# EAGLE design 20m_QRPi_1V6 (EAGLE 6.4)
Assembly variants: 20m
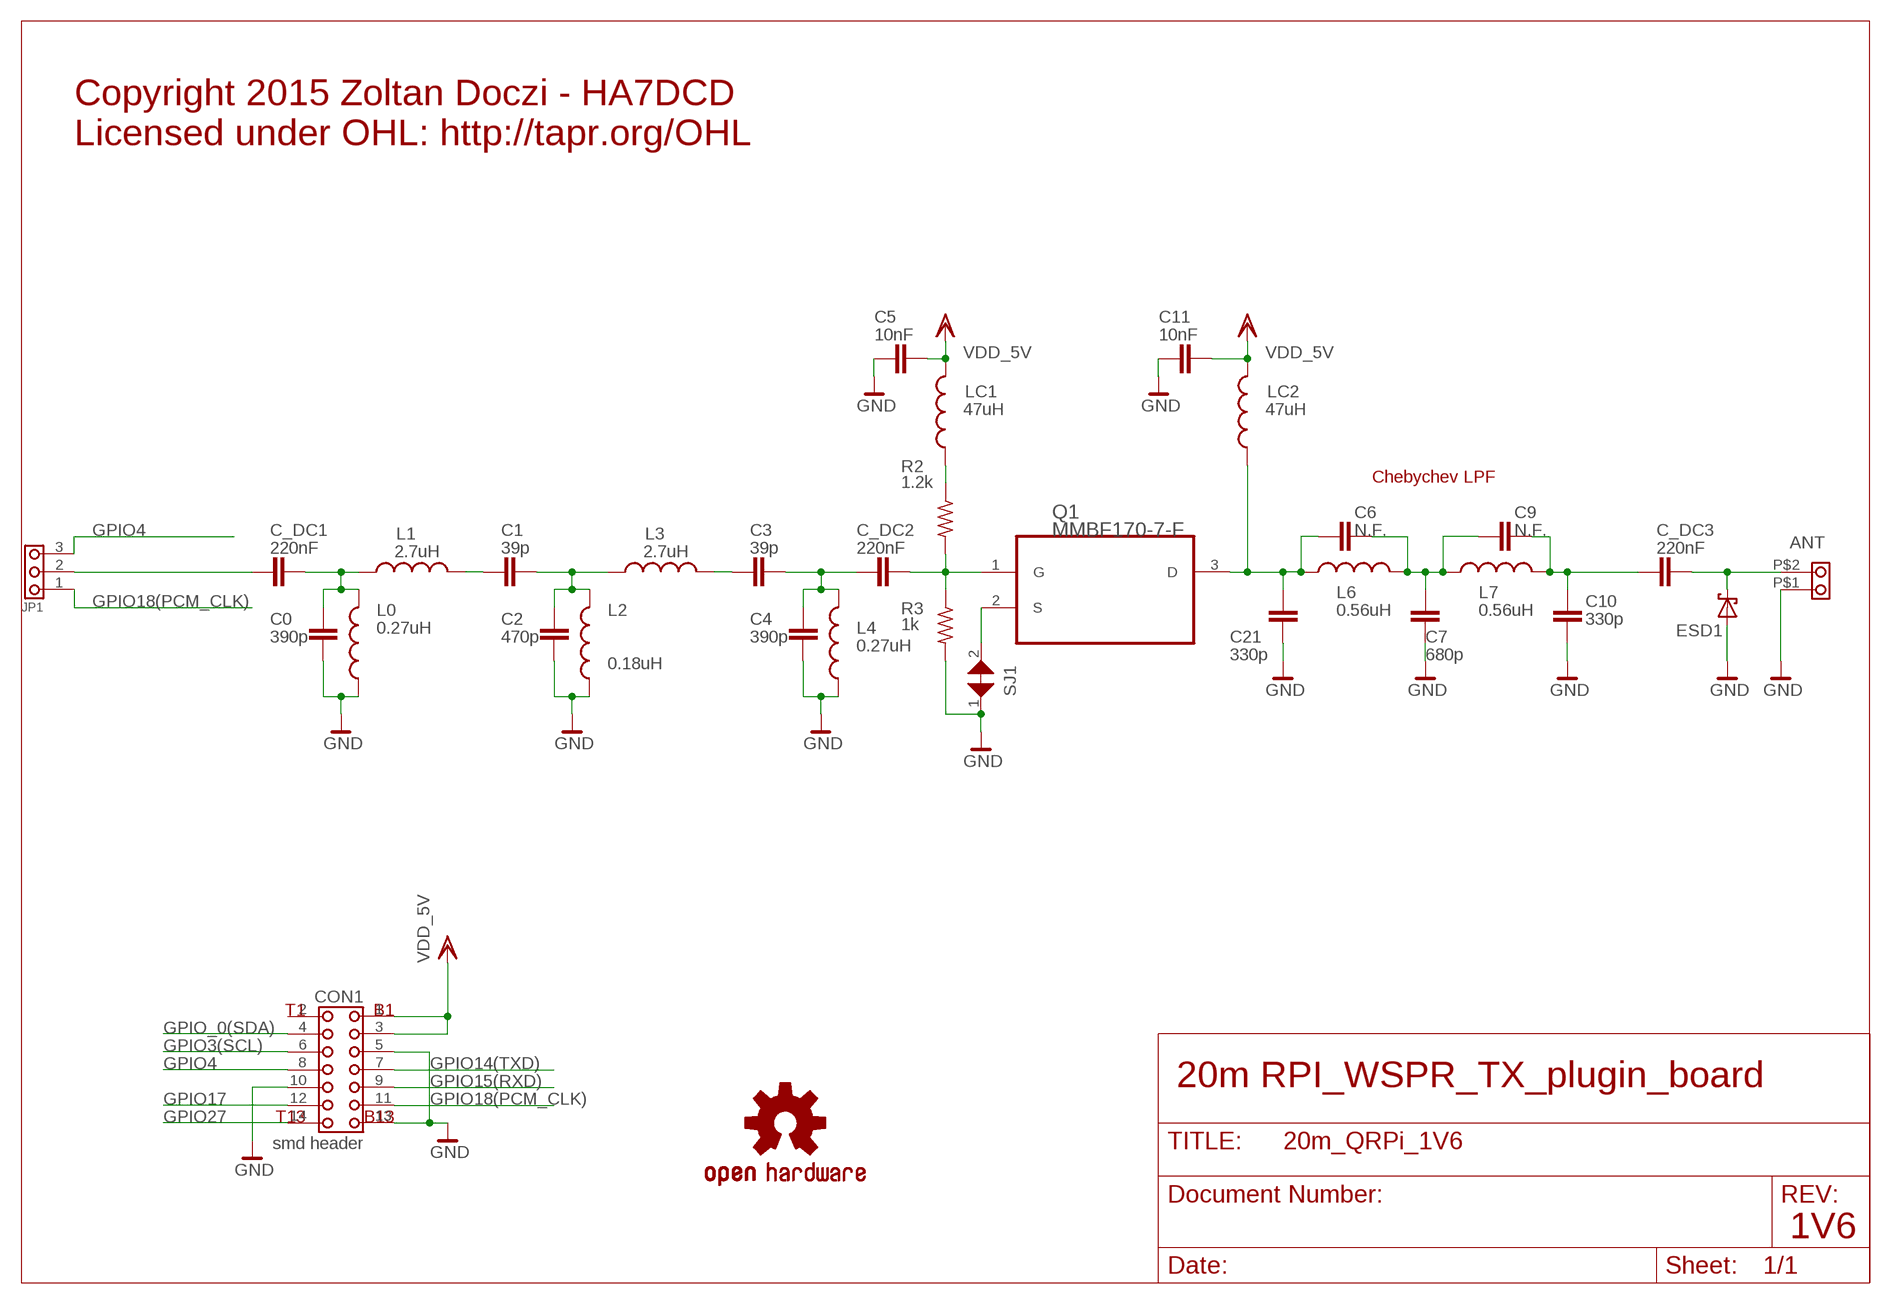
[diagram p0: schematic, sheet 1]

## Parts
ANT  TERMINAL_WIRE_2P_17256562P  [WIRE_CONTACT_2P]
C0  390p  CAP-SMD0603  [0603]
C1  39p  CAP-SMD0603  [0603]
C2  470p  CAP-SMD0603  [0603]
C3  39p  CAP-SMD0603  [0603]
C4  390p  CAP-SMD0603  [0603]
C5  10nF  CAP-SMD0603  [0603]
C6  N.F.  CAP-SMD0603  [0603]
C7  680p  CAP-SMD0603  [0603]
C9  N.F.  CAP-SMD0603  [0603]
C10  330p  CAP-SMD0603  [0603]
C11  10nF  CAP-SMD0603  [0603]
C21  330p  CAP-SMD0603  [0603]
C_DC1  220nF  CAP-SMD0603  [0603]
C_DC2  220nF  CAP-SMD0603  [0603]
C_DC3  220nF  CAP-SMD0603  [0603]
CON1  smd header  PINHD-2X7_SMD2X7_CROSSPCB_ASSYM_DUMMY26PIN  [2X7-SMT_CROSSPCB_ASSYM_DUMY26HOLES]
ESD1  PGB1010603NRHF  SMF33A-GS08_ESD0603  [0603]
JP1  N.F.  JUMPER3SHORT23  [PIN3-B_SHORT23]
L0  0.27uH  INDUCTOR_L_1210  [L1210]
L1  2.7uH  INDUCTOR_L_1210  [L1210]
L2  0.18uH  INDUCTOR_L_1210  [L1210]
L3  2.7uH  INDUCTOR_L_1210  [L1210]
L4  0.27uH  INDUCTOR_L_1210  [L1210]
L6  0.56uH  INDUCTOR_L_1210  [L1210]
L7  0.56uH  INDUCTOR_L_1210  [L1210]
LC1  47uH  INDUCTOR_L_1210  [L1210]
LC2  47uH  INDUCTOR_L_1210  [L1210]
Q1  MMBF170-7-F  [SOT103P240X110-3N]
R2  1.2k  R-US_R0402  [R0402]
R3  1k  R-US_R0402  [R0402]
SJ1  JUMPER_SMD_MICRO_SHORT  [JUMPER_SMD_MICRO_SHORT]
U$15  OSHW-LOGOS  [OSHW-LOGO-S]

## Nets
GND: ANT.P$1(A) C0.1 C2.1 C4.1 C5.2 C7.1 C10.1 C11.2 C21.1 CON1.5 CON1.10 CON1.13 ESD1.1(A) L0.1 L2.1 L4.1 R3.2 SJ1.1
GPIO3(SCL): CON1.6
GPIO4: CON1.8 JP1.3
GPIO14(TXD): CON1.7
GPIO15(RXD): CON1.9
GPIO17: CON1.12
GPIO18(PCM_CLK): CON1.11 JP1.1
GPIO27: CON1.14
GPIO_0(SDA): CON1.4
N$1: C1.2 L1.2
N$2: C0.2 C_DC1.1 L0.2 L1.1
N$3: C_DC2.1 Q1.1(G) R2.2 R3.1
N$4: Q1.2(S) SJ1.2
N$5: LC1.1 R2.1
N$6: C6.2 C21.2 L6.1 LC2.1 Q1.3(D)
N$7: C_DC1.2 JP1.2
N$9: C3.1 C4.2 C_DC2.2 L4.2
N$10: C6.1 C7.2 C9.2 L6.2 L7.1
N$11: C1.1 C2.2 L2.2 L3.1
N$12: C9.1 C10.2 C_DC3.2 L7.2
N$13: C3.2 L3.2
N$20: ANT.P$2(B) C_DC3.1 ESD1.2(C)
VDD_5V: C5.1 C11.1 CON1.1 CON1.3 LC1.2 LC2.2
Unconnected: CON1.2

## Notes on the sheet
- Copyright 2015 Zoltan Doczi - HA7DCD
  Licensed under OHL: http://tapr.org/OHL
- Chebychev LPF
- 20m RPI_WSPR_TX_plugin_board
- 1V6

## Library data of the parts
ANT = dzo:TERMINAL_WIRE_2P_1725656: PHOENIX CONTACT 1725656 TERMINAL BLOCK, WIRE TO BRD, 2POS, 20AWG; DISTRI: Farnell; DISTRINR: 3041359; VENDOR: Phonix
C0 C1-C7 C9-C11 C21 C_DC1-C_DC3 = lve_modositott:CAP-SMD
CON1 = dzo:PINHD-2X7_SMD: SAMTEC CLH-107-F-D-BE Board-To-Board Connector, CLH Series, Surface Mount, Receptacle, 14, 2.54 mm, Gold Plated Contacts; DESCR: Receptacle, 14, 2.54 mm; DISTRI: Farnell; DISTRINR: 1929511; MANUF: SAMTEC; MANUFNR: CLH-107-F-D-BE
ESD1 = dzo:SMF33A-GS08_ESD
JP1 = dzo:JUMPER3
L0 L4 L6 L7 LC1 LC2 = dzo:INDUCTOR_L_1210; DESCR: Inductor, wirewound; MANUF: TDK; MANUFNR: NLCV32 series
L1 L3 = dzo:INDUCTOR_L_1210; DESCR: Inductor, wirewound; DISTRI: Lomex; DISTRINR: 93-00-11; MANUF: TDK; MANUFNR: NLCV32 series
L2 = dzo:INDUCTOR_L_1210; DESCR: Inductor, wirewound; DISTRI: Lomex; DISTRINR: 93-02-20; MANUF: TDK; MANUFNR: NLCV32 series
Q1 = dzo:MMBF170-7-F: N-CHANNEL ENHANCEMENT MODE FIELD EFFECT TRANSISTOR; DISTRI: Farnell; DISTRINR: 1773582; MANUFNR: MMBF170-7-F; OC_NEWARK: 51R6804; PACKAGE: SOT-23-3; VENDOR: DIODES INC.
R2 R3 = resistor:R-US_: RESISTOR, American symbol
SJ1 = dzo:JUMPER_SMD_MICRO_SHORT
U$15 = Pinoccio:OSHW-LOGO: Open Source Hardware Logo This logo indicates the piece of hardware it is found on incorporates a OSHW license and/or adheres to the definition of open source hardware found here: http://freedomdefined.org/OSHW

## Board
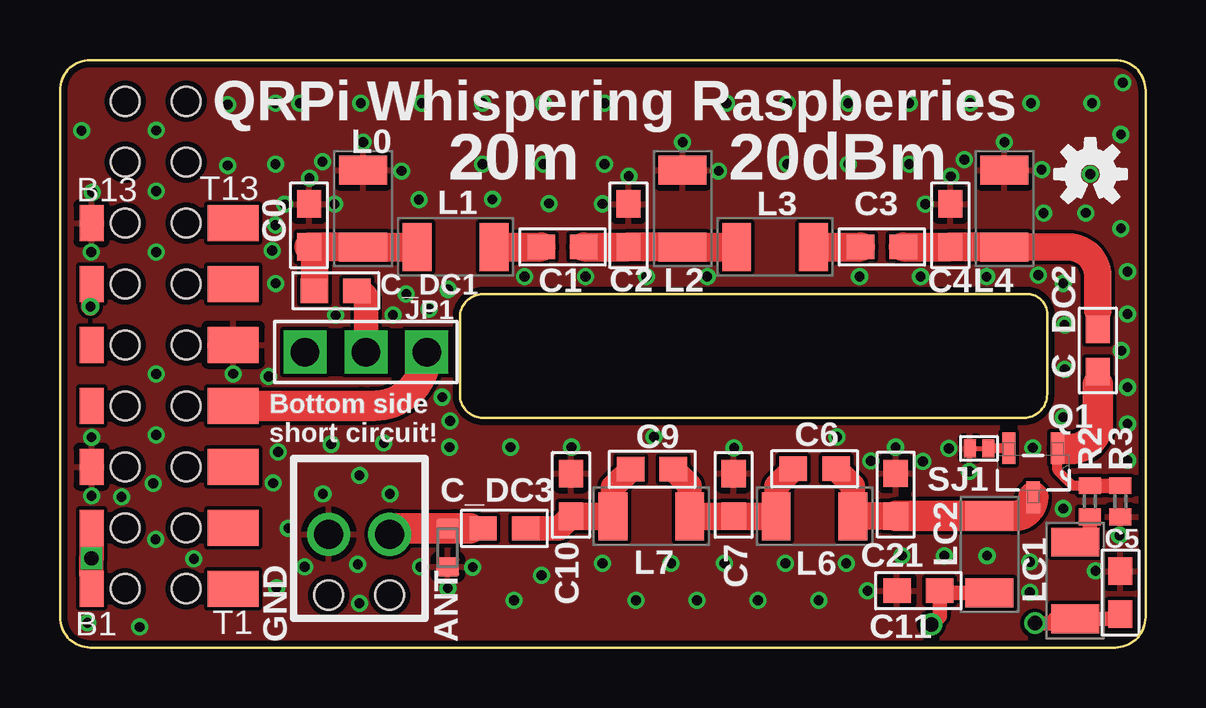
[diagram p1: board, top side]
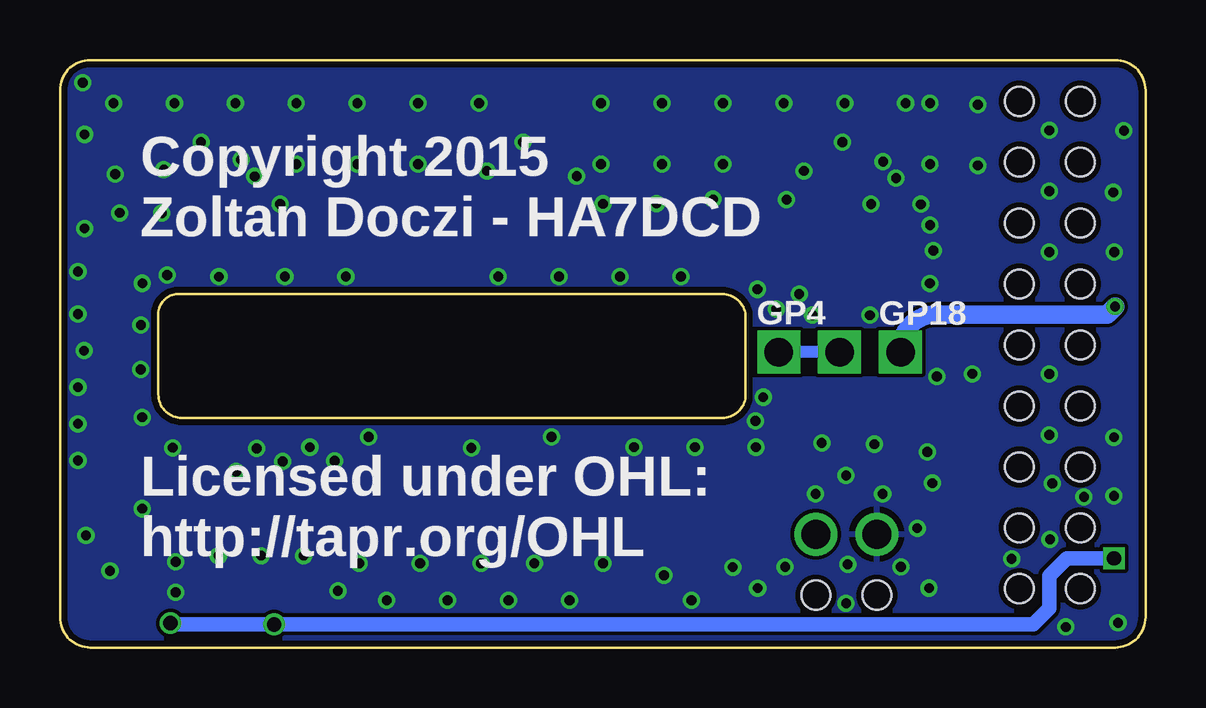
[diagram p2: board, bottom side, seen from below]

Size 45.25 x 24.5 mm. Coordinates in mm from the lower left corner, seen from the top.
Outline: 0,23.23 0,1.27 arc90 1.27,0 43.98,0 arc90 45.25,1.27 45.25,23.23 arc90 43.98,24.5 1.27,24.5 arc90 0,23.23
Outline: 17.65,14.74 40.42,14.74 arc-90 41.15,13.76 41.15,10.55 arc-90 40.17,9.57 17.65,9.57 arc-90 16.67,10.55 16.67,13.76 arc-90 17.65,14.74
Copper layers (1*16): Top 0.035mm / dielectric 1.5mm / Bottom 0.035mm
Design rules "ITEADstudio_DRC": minimum track width 6mil, minimum drill 12mil, track to track 6mil, track to pad 6mil, pad to pad 6mil, via to via 6mil, smd to smd 0mil, copper to edge 10mil, drill to drill 10mil, minimum pad ring 10mil, minimum via ring 6mil, stop-mask expansion 2mil, vias tented up to drill 100mil, thermal gap 10mil

### Footprints (pad centres in the part's own frame; a part is rotated, then mirrored left to right if it is on the bottom)
WIRE_CONTACT_2P = drill 1.2: P$1 -1.27,1.27; P$2 1.27,1.27 | hole 1.2: -1.27,-1.27; 1.27,-1.27
0603 = smd 1.143 x 1.016: 1 -0.889,0; 2 0.889,0
2X7-SMT_CROSSPCB_ASSYM_DUMY26HOLES = smd 1.5 x 1: 1 -7.59,2.7; 3 -5.05,2.7; 5 -2.51,2.7; 7 0.03,2.7; 9 2.57,2.7; 11 5.11,2.7; 13 7.65,2.7 | smd 1.5 x 2.13: 2 -7.59,-3.205; 4 -5.05,-3.205; 6 -2.51,-3.205; 8 0.03,-3.205; 10 2.57,-3.205; 12 5.11,-3.205; 14 7.65,-3.205 | hole 1.2: -7.59,1.3; -5.05,1.3; -2.51,1.3; 0.03,1.3; 2.57,1.3; 5.11,1.3; 7.65,1.3; -7.59,-1.24; -5.05,-1.24; -2.51,-1.24; 0.03,-1.24; 2.57,-1.24; 5.11,-1.24; 7.65,-1.24; 10.19,-1.24; 12.73,-1.24; 10.19,1.3; 12.73,1.3
0603' = smd 0.8 x 0.95: 1 -0.8,0; 2 0.8,0
PIN3-B_SHORT23 = drill 1.194 square: 1 -2.54,0; 2 0,0; 3 2.54,0
L1210 = smd 1.2 x 2: 1 -1.6,0; 2 1.6,0
SOT103P240X110-3N = smd 1.321 x 0.559: 1 -1.016,1.016; 2 -1.016,-1.016; 3 1.016,0
R0402 = smd 0.7 x 0.9: 1 -0.65,0; 2 0.65,0
JUMPER_SMD_MICRO_SHORT = smd 0.508 x 0.762: 1 -0.381,0; 2 0.381,0

### Placement (x,y rotation side)
ANT  12.47,3.45 0 top
C0  10.38,17.6 270 top
C1  20.95,16.7 180 top
C2  23.7,17.6 270 top
C3  34.26,16.7 180 top
C4  37.12,17.6 270 top
C5  44.2,2.29 90 top
C6  31.46,7.45 0 top
C7  28.08,6.36 270 top
C9  24.68,7.43 0 top
C10  21.3,6.36 270 top
C11  35.78,2.37 180 top
C21  34.84,6.37 270 top
C_DC1  11.49,14.88 0 top
C_DC2  43.26,12.39 90 top
C_DC3  18.53,4.97 0 top
CON1  4.01,10.04 90 top
ESD1  PGB1010603NRHF  [0603']  16.16,4.17 90 top
JP1  12.75,12.32 0 top
L0  12.64,18.3 270 top
L1  16.49,16.7 0 top
L2  25.95,18.3 270 top
L3  29.81,16.7 0 top
L4  39.37,18.3 270 top
L6  31.46,5.48 180 top
L7  24.65,5.47 180 top
LC1  42.31,2.79 270 top
LC2  38.75,3.89 270 top
Q1  40.57,7.29 270 top
R2  42.93,6.1 90 top
R3  44.2,6.1 270 top
SJ1  38.31,8.3 0 top
U$15  42.95,19.74 0 top

### Tracks (layer width: path | path; a pad name or v marks a point on that pad's centre or on a via)
GND  (via drill 0.41)
  other vias: 16.17,2.47 17.2,3.35 39.37,21.07 37.14,19.65 40.92,19.93 36.07,18.49 27.46,19.87 25.96,21.07 23.71,19.66 22.62,18.5 14.24,19.87 12.64,21.07 10.4,19.58 44.17,4.68 9.09,8.15 11.3,8.48 43.02,22.7 37.94,22.7 32.86,22.7 27.78,22.7 22.7,22.7 17.62,22.7 12.54,22.7 8.98,22.7 8.98,20.16 8.98,17.62 14.44,14.74 6.99,20.1 6.99,22.64 0.9,21.55 4.01,21.57 4.01,19.03 4.01,16.49 4.01,11.41 4.01,8.87 44.23,17.48 35.97,7.76 1.14,1.03 1.34,18.98 1.32,8.77 1.31,6.32 2.57,6.28 3.88,6.85 5.58,3.7 11.44,18.49 9.36,18.48 10.94,20.26 20.39,18.52 18.02,18.69 14.96,18.67 37.69,20.34 41.82,15.19 41.88,13.45 40.79,15.53 38.62,15.46 35.87,15.47 33.33,15.47 26.98,15.47 24.44,15.47 21.9,15.47 19.36,15.47 16.17,14.94 17.62,20.16 20.16,20.16 20.16,22.7 22.7,20.16 30.32,22.7 30.32,20.16 32.86,20.16 35.4,20.16 35.4,22.7 40.48,22.7 10,22.7 15.08,22.7 42.95,19.74 41,18.11 21.32,8.35 28.1,8.33 34.83,8.35 31.63,1.97 29.09,1.97 26.55,1.97 24.01,1.97 20.08,3.01 22.62,3.51 25.48,3.51 27.7,3.51 30.24,3.51 32.78,3.51 18.78,8.35 16.24,8.35 13.5,8.53 24.76,8.79 32.38,8.79 33.8,7.79 44.22,21.4 41.88,11.6 37.05,8.3 7.22,11.42 1.3,16.49 3.98,4.51 3.32,0.86 18.93,1.97 9.02,2.48 8.89,6.86 10.96,6.41 9.52,4.98 8.85,16.55 40.42,2.31 44.25,12.38 13.75,6.41 12.41,3.47 12.48,7.17 10.2,3.36 15.02,3.36 12.48,1.84 43.17,3.2 40.42,3.58 38.65,3.83 36.87,3.83 35.09,3.83 33.66,2.37 37.91,7.35 44.5,7.81 44.5,9.33 44.5,10.85 44.5,13.9 44.5,15.68 44.3,23.55 42.76,18.12 41.83,5.79 40.56,8.33 41.83,9.6 15.39,14.12 8.99,15.18 16.26,9.45 15.93,10.44 11.48,13.86 13.88,13.87 8.7,11.3
  pour Top (rank 2): 45.25,0 0.01,0 0,24.5 45.25,24.5
  pour Bottom (rank 2): 45.25,0 0.01,0 0,24.5 45.25,24.5
GPIO4
  Top 1.27: CON1.8 12.56,10.07 13.05,10.07 arc90 JP1.3
GPIO18(PCM_CLK)  (via drill 0.41)
  Top 0.762: v1.27,14.22 1.27,15.11 CON1.11
  Bottom 0.762: v1.27,14.22 1.6,13.89 2.49,13.89 8.51,13.89 8.56,13.89 8.74,13.89 arc-90 10.21,12.42 JP1.1
N$1
  Top 1.2: L1.2 C1.2
N$2
  Top 0.762: C_DC1.1 10.61,15.34 10.62,15.34
  Top 1.143: 10.62,15.34 10.62,16.71 C0.2
  Top 1.2: C0.2 12.63,16.71 arc-90 L0.2 L1.1
N$3
  Top 0.305: 41.63,8.38 41.58,8.38 Q1.1
  Top 0.406: 41.92,8.29 41.63,8.38 | R2.2 42.22,6.75 41.58,7.39 Q1.1
  Top 0.61: 43.25,10.96 C_DC2.1 | R2.2 R3.1
  Top 1.27: 43.25,10.96 43.26,10.95 43.26,9.22 arc-90 41.92,8.29
N$4
  Top 0.406: Q1.2 SJ1.2
N$5
  Top 0.61: R2.1 42.93,4.57 42.35,4.57 LC1.1
N$6
  Top 0.406: 39.75,5.48 39.74,5.49 LC2.1
  Top 1.016: C6.2 33.06,6.74 L6.1
  Top 1.143: C21.2 L6.1
  Top 1.27: C21.2 39.75,5.48 arc90 Q1.3
N$7
  Top 1.016: C_DC1.2 12.45,14.88 arc-90 12.55,14.78 arc-90 12.75,14.58 JP1.2
N$9
  Top 0.406: 43.26,15.06 43.26,15.24
  Top 0.813: 43.26,15.06 C_DC2.2
  Top 1.143: L4.2 42.03,16.7 arc-90 43.27,15.47 arc90 43.26,15.47 43.26,15.24 43.26,14.05
  Top 1.2: C3.1 37.1,16.7 arc90 C4.2 39.36,16.71 arc-90 L4.2
N$10
  Top 0.559: L6.2 | L6.2 C7.2
  Top 1.016: C9.2 26.25,6.76 L7.1 | C6.1 29.86,6.74 L6.2
  Top 1.143: L7.1 L6.2
N$11
  Top 1.2: C1.1 23.69,16.7 arc90 C2.2 25.94,16.71 arc-90 L2.2 L3.1
N$12
  Top 1.016: C9.1 23.05,6.69 L7.2 | C_DC3.2 20.8,4.97 C10.2
  Top 1.143: C10.2 L7.2
N$13
  Top 1.2: L3.2 C3.2
N$20
  Top 0.813: C_DC3.1 16.92,4.97 16.77,4.97 arc-90 16.76,4.98 | 16.41,4.97 arc90 ESD1.2
  Top 1.27: 16.76,4.98 17.09,4.98 | ANT.P$2 13.75,4.7 14.01,4.97 16.41,4.97 16.92,4.97
VDD_5V  (via drill 0.6)
  Top 0.61: C5.1 44.25,1.19 LC1.2 41.48,1.19 41.3,1.02 v40.64,1.02 | LC2.2 36.75,2.29 C11.1 36.67,1.31 v36.32,0.96
  Top 1.016: CON1.1 1.31,3.51 v1.31,3.72 v1.31,3.73 CON1.3
  Bottom 0.5: 1.62,3.73 v1.31,3.72
  Bottom 0.61: 1.62,3.73 3.28,3.73 4.01,3 4.01,1.63 4.67,0.96 v36.32,0.96 40.59,0.96 v40.64,1.02

### Text on the board
Top: TOP
Bottom: BOTTOM
tPlace: QRPi Whispering Raspberries | 20m | 20dBm | Bottom side / short circuit! | GND
bPlace: Copyright 2015 / Zoltan Doczi - HA7DCD | GP18 | GP4 | Licensed under OHL: / http://tapr.org/OHL